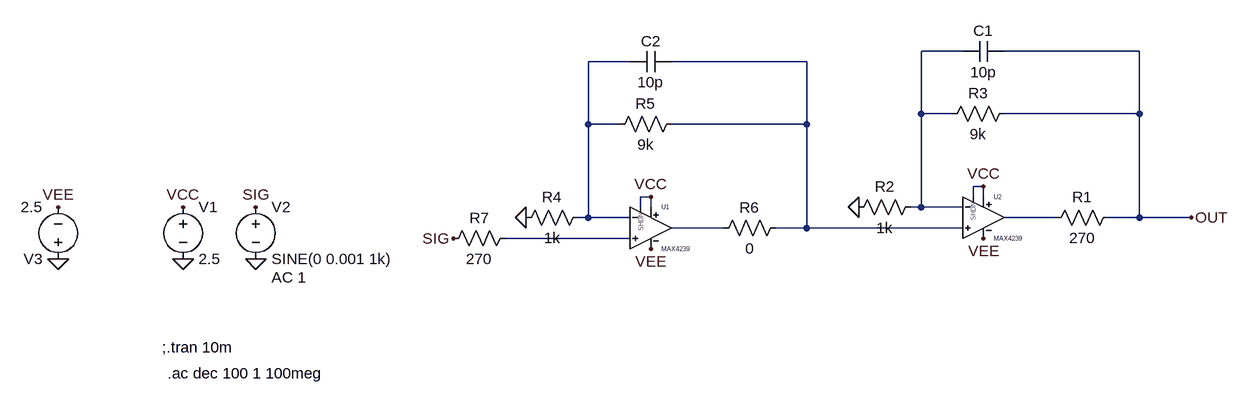
[diagram p0: schematic max4239_two_stages_ucurrent.asc]
max4239_two_stages_ucurrent.asc, the LTspice schematic file:
Version 4
SHEET 1 880 680
WIRE 192 -80 128 -80
WIRE 464 -80 256 -80
WIRE -320 -64 -384 -64
WIRE -48 -64 -256 -64
WIRE 128 16 128 -80
WIRE 176 16 128 16
WIRE 464 16 464 -80
WIRE 464 16 256 16
WIRE -384 32 -384 -64
WIRE -336 32 -384 32
WIRE -48 32 -48 -64
WIRE -48 32 -256 32
WIRE 224 128 208 128
WIRE -288 144 -304 144
WIRE 208 144 208 128
WIRE 224 144 224 128
WIRE -304 160 -304 144
WIRE -288 160 -288 144
WIRE 128 160 128 16
WIRE 128 160 112 160
WIRE 192 160 128 160
WIRE -384 176 -384 32
WIRE -384 176 -400 176
WIRE -320 176 -384 176
WIRE 336 176 256 176
WIRE 464 176 464 16
WIRE 464 176 416 176
WIRE 544 176 464 176
WIRE -176 192 -256 192
WIRE -48 192 -48 32
WIRE -48 192 -96 192
WIRE 192 192 -48 192
WIRE -320 208 -512 208
FLAG -1008 240 0
FLAG -1008 160 VCC
FLAG 224 128 VCC
FLAG -896 240 0
FLAG -896 160 SIG
FLAG 544 176 OUT
FLAG 32 160 0
FLAG -288 144 VCC
FLAG -592 208 SIG
FLAG -480 176 0
FLAG -1200 240 0
FLAG -1200 160 VEE
FLAG -288 224 VEE
FLAG 224 208 VEE
SYMBOL voltage -1008 144 R0
WINDOW 123 0 0 Left 0
WINDOW 39 0 0 Left 0
SYMATTR InstName V1
SYMATTR Value 2.5
SYMBOL voltage -896 144 R0
WINDOW 123 24 124 Left 2
WINDOW 39 0 0 Left 0
SYMATTR Value2 AC 1
SYMATTR InstName V2
SYMATTR Value SINE(0 0.001 1k)
SYMBOL res 128 144 R90
WINDOW 0 0 56 VBottom 2
WINDOW 3 32 56 VTop 2
SYMATTR InstName R2
SYMATTR Value 1k
SYMBOL res 272 0 R90
WINDOW 0 0 56 VBottom 2
WINDOW 3 32 56 VTop 2
SYMATTR InstName R3
SYMATTR Value 9k
SYMBOL MAX4239 224 112 R0
SYMATTR InstName U2
SYMBOL res 432 160 R90
WINDOW 0 0 56 VBottom 2
WINDOW 3 32 56 VTop 2
SYMATTR InstName R1
SYMATTR Value 270
SYMBOL cap 256 -96 R90
WINDOW 0 0 32 VBottom 2
WINDOW 3 32 32 VTop 2
SYMATTR InstName C1
SYMATTR Value 10p
SYMBOL res -384 160 R90
WINDOW 0 0 56 VBottom 2
WINDOW 3 32 56 VTop 2
SYMATTR InstName R4
SYMATTR Value 1k
SYMBOL res -240 16 R90
WINDOW 0 0 56 VBottom 2
WINDOW 3 32 56 VTop 2
SYMATTR InstName R5
SYMATTR Value 9k
SYMBOL MAX4239 -288 128 R0
SYMATTR InstName U1
SYMBOL res -80 176 R90
WINDOW 0 0 56 VBottom 2
WINDOW 3 32 56 VTop 2
SYMATTR InstName R6
SYMATTR Value 0
SYMBOL cap -256 -80 R90
WINDOW 0 0 32 VBottom 2
WINDOW 3 32 32 VTop 2
SYMATTR InstName C2
SYMATTR Value 10p
SYMBOL voltage -1200 256 R180
WINDOW 123 0 0 Left 0
WINDOW 39 0 0 Left 0
SYMATTR InstName V3
SYMATTR Value 2.5
SYMBOL res -496 192 R90
WINDOW 0 0 56 VBottom 2
WINDOW 3 32 56 VTop 2
SYMATTR InstName R7
SYMATTR Value 270
TEXT -1040 376 Left 2 !;.tran 10m
TEXT -1032 416 Left 2 !.ac dec 100 1 100meg

The netlist it stands for:
* max4239_two_stages_ucurrent.asc
V1 VCC 0 2.5
V2 SIG 0 SINE(0 0.001 1k) AC 1
R2 N001 0 1k
R3 OUT N001 9k
XU2 VCC N001 N003 VEE N004 VCC MAX4239  ; pins SHDN IN- IN+ GND OUT VCC
R1 OUT N004 270
C1 OUT N001 10p
R4 N002 0 1k
R5 N003 N002 9k
XU1 VCC N002 N006 VEE N005 VCC MAX4239  ; pins SHDN IN- IN+ GND OUT VCC
R6 N003 N005 0
C2 N003 N002 10p
V3 0 VEE 2.5
R7 N006 SIG 270
;.tran 10m
.ac dec 100 1 100meg
.lib MAX4239.lib
.backanno
.end